# Altium schematic sheet GR_carte_action_actionneurs27.SchDoc
size A4; SheetNumber: 2; SheetTotal: 2
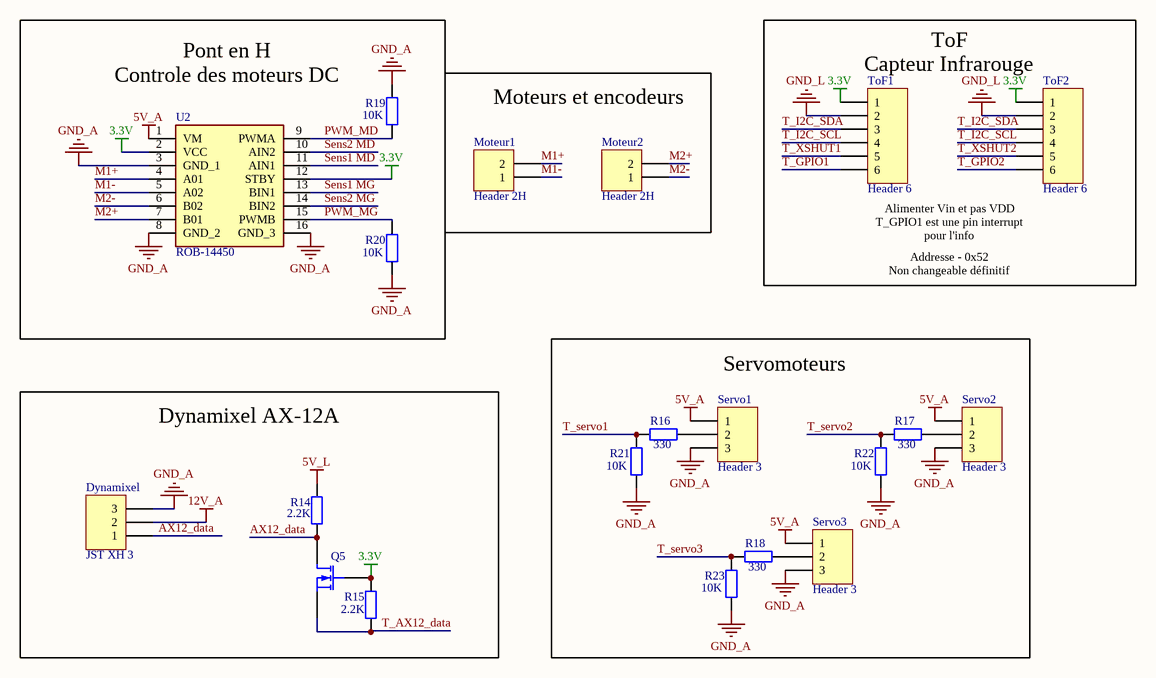
[diagram p0: GR_carte_action_actionneurs27.SchDoc]

## Parts
Dynamixel  JST XH 3  [S3B-XH-A]
Moteur1  Header 2H  [JST XH B2B-XH-A]
Moteur2  Header 2H  [JST XH B2B-XH-A]
Q5  MOSFET-N  [SOT23_M]  (value not drawn)
R14  value 2.2K  [Resistor 1206]  (hidden comment: Res2)
R15  value 2.2K  [Resistor 1206]  (hidden comment: Res2)
R16  value 330  [Resistor 1206]  (hidden comment: Res2)
R17  value 330  [Resistor 1206]  (hidden comment: Res2)
R18  value 330  [Resistor 1206]  (hidden comment: Res2)
R19  value 10K  [Resistor 1206]  (hidden comment: Res2)
R20  value 10K  [Resistor 1206]  (hidden comment: Res2)
R21  value 10K  [Resistor 1206]  (hidden comment: Res2)
R22  value 10K  [Resistor 1206]  (hidden comment: Res2)
R23  value 10K  [Resistor 1206]  (hidden comment: Res2)
Servo1  Header 3  [JST XH B3B-XH-A]
Servo2  Header 3  [JST XH B3B-XH-A]
Servo3  Header 3  [JST XH B3B-XH-A]
ToF1  Header 6  [JST XH B6B-XH-A]
ToF2  Header 6  [JST XH B6B-XH-A]
U2  ROB-14450  [ROB14450]

## Blocks framed on the sheet
Moteurs et encodeurs: Moteur1 Moteur2
Dynamixel AX-12A: Dynamixel Q5 R14 R15

## Nets
3.3V: Q5.2(G) R15.2 ToF1.1 ToF2.1 U2.2(VCC) U2.12(STBY)
5V_A: Servo1.1 Servo2.1 Servo3.1 U2.1(VM)
5V_L: R14.2
12V_A: Dynamixel.2
GND_A: Dynamixel.3 R19.2 R20.1 R21.1 R22.1 R23.1 Servo1.3 Servo2.3 Servo3.3 U2.3(GND_1) U2.8(GND_2) U2.16(GND_3)
GND_L: ToF1.2 ToF2.2
AX12_data: Dynamixel.1 Q5.1(D) R14.1
M1+: Moteur1.2 U2.4(A01)
M1-: Moteur1.1 U2.5(A02)
M2+: Moteur2.2 U2.7(B01)
M2-: Moteur2.1 U2.6(B02)
PWM_MD: R19.1 U2.9(PWMA)
PWM_MG: R20.2 U2.15(PWMB)
Sens1 MD: U2.11(AIN1)
Sens1 MG: U2.13(BIN1)
Sens2 MD: U2.10(AIN2)
Sens2 MG: U2.14(BIN2)
T_AX12_data: Q5.3(S) R15.1
T_GPIO1: ToF1.6
T_GPIO2: ToF2.6
T_I2C_SCL: ToF1.4 ToF2.4
T_I2C_SDA: ToF1.3 ToF2.3
T_servo1: R16.1 R21.2
T_servo2: R17.1 R22.2
T_servo3: R18.1 R23.2
T_XSHUT1: ToF1.5
T_XSHUT2: ToF2.5
NetR16_2: R16.2 Servo1.2
NetR17_2: R17.2 Servo2.2
NetR18_2: R18.2 Servo3.2

## Notes on the sheet
- Pont en H
  Controle des moteurs DC
- ToF
  Capteur Infrarouge
- Alimenter Vin et pas VDD
  T_GPIO1 est une pin interrupt pour l'info
- Addresse - 0x52
  Non changeable définitif
- Servomoteurs

## Library data of the parts
Dynamixel = Header 3H: Header, 3-Pin, Right Angle; LatestRevisionDate: 17-Jul-2002; LatestRevisionNote: Re-released for DXP Platform.; Publisher: Altium Limited
Moteur1 Moteur2 = Header 2H: Header, 2-Pin, Right Angle; LatestRevisionDate: 17-Jul-2002; LatestRevisionNote: Re-released for DXP Platform.; Publisher: Altium Limited
Q5 = MOSFET-N: N-Channel MOSFET; pin to pad: 2>3 3>2; Published: 8-Jun-2000; LatestRevisionDate: 17-Jul-2002; LatestRevisionNote: Re-released for DXP Platform.; PackageVersion: 1995/1996; PackageReference: E3; Publisher: Altium Limited; PackageDescription: TO, Flat Index; 3 In-Line, Axial Leads; Body Dia. 4.6mm; Lead Dia. 0.5 mm (max)
R14-R23 = Res2: Resistor; Published: 8-Jun-2000; LatestRevisionDate: 17-Jul-2002; LatestRevisionNote: Re-released for DXP Platform.; PackageReference: AXIAL-0.4; Publisher: Altium Limited; PackageDescription: Axial Device, Thru-Hole; 2 Leads; 0.4 in Pin Spacing
Servo1-Servo3 = Header 3: Header, 3-Pin; LatestRevisionDate: 17-Jul-2002; LatestRevisionNote: Re-released for DXP Platform.; Publisher: Altium Limited
ToF1 ToF2 = Header 6: Header, 6-Pin; LatestRevisionDate: 17-Jul-2002; LatestRevisionNote: Re-released for DXP Platform.; Publisher: Altium Limited
U2 = ROB-14450: Undefined or Miscellaneous; Manufacturer_Name: SparkFun; Datasheet Link: https://www.sparkfun.com/products/14450; Height: 5mm; Manufacturer_Part_Number: ROB-14450; Mouser Part Number: 474-ROB-14450; Mouser Price/Stock: https://www.mouser.co.uk/ProductDetail/SparkFun/ROB-14450?qs=wd5RIQLrsJhQdlH%2FW5H2aQ%3D%3D; Arrow Part Number: ROB-14450; Arrow Price/Stock: https://www.arrow.com/en/products/rob-14450/sparkfun-electronics?region=nac